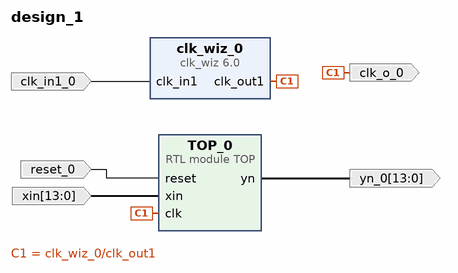
[diagram p0: block diagram of the top level]
# Vivado block design design_1, xc7a35tcpg236-1, Vivado 2024.1
create_bd_design design_1

create_bd_port -dir O -from 13 -to 0 yn_0
create_bd_port -dir I -type clk clk_in1_0
create_bd_port -dir I -type rst reset_0
create_bd_port -dir I -from 13 -to 0 xin
create_bd_port -dir O clk_o_0

create_bd_cell -type module -reference TOP TOP_0
create_bd_cell -type ip -vlnv xilinx.com:ip:clk_wiz:6.0 clk_wiz_0
set_property -dict [list \
  CONFIG.CLKOUT1_JITTER 159.371 \
  CONFIG.CLKOUT1_PHASE_ERROR 98.575 \
  CONFIG.CLKOUT1_REQUESTED_OUT_FREQ 40 \
  CONFIG.CLK_IN1_BOARD_INTERFACE sys_clock \
  CONFIG.MMCM_CLKFBOUT_MULT_F 10.000 \
  CONFIG.MMCM_CLKOUT0_DIVIDE_F 25.000 \
  CONFIG.MMCM_DIVCLK_DIVIDE 1 \
  CONFIG.RESET_BOARD_INTERFACE reset \
  CONFIG.USE_LOCKED false \
  CONFIG.USE_RESET false \
] [get_bd_cells clk_wiz_0]

# ---- connections ----

connect_bd_net [get_bd_pins TOP_0/yn] [get_bd_ports yn_0]
connect_bd_net -net clk_div_0_clk_o [get_bd_pins clk_wiz_0/clk_out1] [get_bd_ports clk_o_0] [get_bd_pins TOP_0/clk]
connect_bd_net -net clk_in1_0_1 [get_bd_ports clk_in1_0] [get_bd_pins clk_wiz_0/clk_in1]
connect_bd_net -net reset_0_1 [get_bd_ports reset_0] [get_bd_pins TOP_0/reset]
connect_bd_net -net xin_0_1 [get_bd_ports xin] [get_bd_pins TOP_0/xin]

validate_bd_design
save_bd_design
